# Altium project Main_Board.PrjPcb (part 23 of 44)

## Sheet ADP1741_3.6V_3.3V@2A.SchDoc
size A4
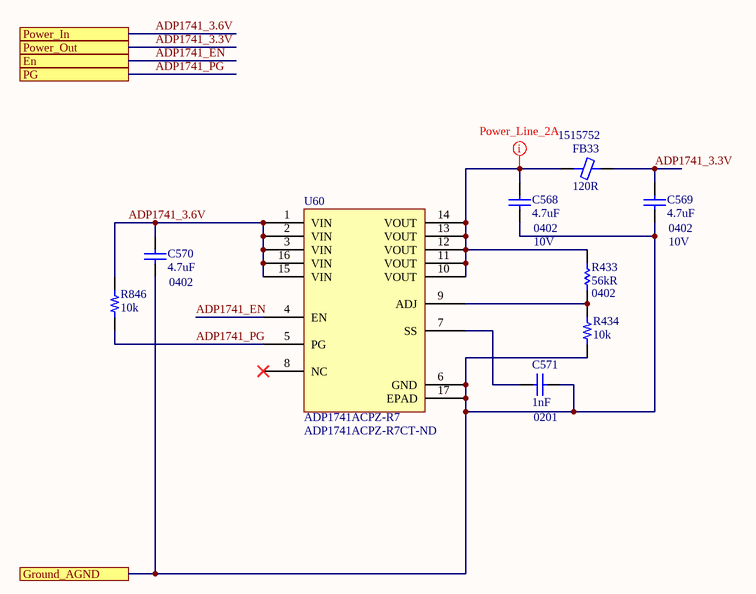
[diagram p29: ADP1741_3.6V_3.3V@2A.SchDoc]

### Parts
(Parts that share a designator on the sheet are numbered #1, #2 ... from top to bottom, then left to right.)
C568  4.7uF  Case/Package: 0402  Voltage Rating: 10V  [CAP 0402/1005 KK]
C569  4.7uF  Case/Package: 0402  Voltage Rating: 10V  [CAP 0402/1005 KK]
C570  4.7uF  Case/Package: 0402  [CAP 0402/1005 KK]
C571  1nF  Case/Package: 0201  [CAP 0201/0603 KK]
FB33  120R  Supplier Part Number 1: 1515752  [FER 0603/1608]
R433  56kR  Case/Package: 0402  [RES 0402/1005 RF KK]
R434  10k  [RES 0402/1005 RF KK]
R846#1  10k  [RES 0402/1005 RF KK]
U60  ADP1741ACPZ-R7  Supplier Part Number 1: ADP1741ACPZ-R7CT-ND  [ADP1752_1753/ADP1740_1741]

### Ports
En, Ground_AGND, PG, Power_In, Power_Out

### Nets
ADP1741_3.3V: C569.2 FB33.2 ; port Power_Out  [project net 3.3V_LN_1]
ADP1741_3.6V: C570.2 R846#1.1 U60.1(VIN) U60.2(VIN) U60.3(VIN) U60.15(VIN) U60.16(VIN) ; port Power_In
ADP1741_EN: U60.4(EN) ; port En
ADP1741_PG: R846#1.2 U60.5(PG) ; port PG
AGND: C568.1 C569.1 C570.1 C571.2 R434.2 U60.6(GND) U60.17(EPAD) ; port Ground_AGND
NetC568_2: C568.2 FB33.1 R433.2 U60.10(VOUT) U60.11(VOUT) U60.12(VOUT) U60.13(VOUT) U60.14(VOUT)
NetC571_1: C571.1 U60.7(SS)
NetR433_1: R433.1 R434.1 U60.9(ADJ)

Not connected (* = marked no-connect by the designer): U60 8(NC)*

### Layout directives
net class Power_Line_2A: NetC568_2

### Notes on the sheet
- Title
- Size:
- Date:
- A3
- Number:
- Time:
- Revision:
- Sheet
- of
- File:

### Library data of the parts
C568 C569 = Capacitor: 0402 10 V 4.7 uF ±20% Tolerance X5R Multilayer Ceramic Chip Capacitor; Manufacturer: Murata; Manufacturer Part Number: GRM155R61A475MEAAD; Supplier 1: Digi-Key; Supplier Part Number 1: 490-14306-1-ND; Category: Ceramic Capacitors; Stock 1: 980102; Pricing 1: 1=0,23000, 10=0,15400, 100=0,07780, 500=0,05322, 1000=0,04708, 2500=0,04504, 5000=0,04094 (USD); Mount: Surface Mount; Case Code (Imperial): 0402; Case Code (Metric): 1005; Min Operating Temperature: -55°C; Max Operating Temperature: 85°C; Packaging: Tape and Reel; Capacitance: 4.7uF; Tolerance: 20%; ComponentLink1URL: http://www.farnell.com/datasheets/2189109.pdf?src-supplier=Farnell; ComponentLink1Description: http://www.farnell.com/datasheets/2189109.pdf?src-supplier=Farnell; ComponentLink2URL: https://search.murata.co.jp/Ceramy/image/img/A01X/G101/ENG/GRM155R61A475MEAA-01.pdf?src-supplier=Digi-Key; ComponentLink2Description: https://search.murata.co.jp/Ceramy/image/img/A01X/G101/ENG/GRM155R61A475MEAA-01.pdf?src-supplier=Digi-Key; ComponentLink3URL: http://datasheet.octopart.com/GRM155R61A475MEAAD-Murata-datasheet-68589269.pdf?src-supplier=Newark; ComponentLink3Description: http://datasheet.octopart.com/GRM155R61A475MEAAD-Murata-datasheet-68589269.pdf?src-supplier=Newark; ComponentLink4URL: http://datasheet.octopart.com/GRM155R61A475MEAAD-Murata-datasheet-8819587.pdf; ComponentLink4Description: http://datasheet.octopart.com/GRM155R61A475MEAAD-Murata-datasheet-8819587.pdf; ComponentLink5URL: http://datasheet.octopart.com/GRM155R61A475MEAAD-Murata-datasheet-10025737.pdf; ComponentLink5Description: http://datasheet.octopart.com/GRM155R61A475MEAAD-Murata-datasheet-10025737.pdf; ComponentLink6URL: http://datasheet.octopart.com/GRM155R61A475MEAAD-Murata-datasheet-11978611.pdf; ComponentLink6Description: http://datasheet.octopart.com/GRM155R61A475MEAAD-Murata-datasheet-11978611.pdf; ComponentLink7URL: http://datasheet.octopart.com/GRM155R61A475MEAAD-Murata-datasheet-12510076.pdf; ComponentLink7Description: http://datasheet.octopart.com/GRM155R61A475MEAAD-Murata-datasheet-12510076.pdf; ComponentLink8URL: http://datasheet.octopart.com/GRM155R61A475MEAAD-Murata-datasheet-12515295.pdf; ComponentLink8Description: http://datasheet.octopart.com/GRM155R61A475MEAAD-Murata-datasheet-12515295.pdf
C570 = Capacitor: 0402 10 V 4.7 uF ±20% Tolerance X5R Multilayer Ceramic Chip Capacitor; Manufacturer: Murata; Manufacturer Part Number: GRM155R61A475MEAAD; Voltage Rating: 10V; Supplier 1: Digi-Key; Supplier Part Number 1: 490-14306-1-ND; Category: Ceramic Capacitors; Stock 1: 980102; Pricing 1: 1=0,23000, 10=0,15400, 100=0,07780, 500=0,05322, 1000=0,04708, 2500=0,04504, 5000=0,04094 (USD); Mount: Surface Mount; Case Code (Imperial): 0402; Case Code (Metric): 1005; Min Operating Temperature: -55°C; Max Operating Temperature: 85°C; Packaging: Tape and Reel; Capacitance: 4.7uF; Tolerance: 20%; ComponentLink1URL: http://www.farnell.com/datasheets/2189109.pdf?src-supplier=Farnell; ComponentLink1Description: http://www.farnell.com/datasheets/2189109.pdf?src-supplier=Farnell; ComponentLink2URL: https://search.murata.co.jp/Ceramy/image/img/A01X/G101/ENG/GRM155R61A475MEAA-01.pdf?src-supplier=Digi-Key; ComponentLink2Description: https://search.murata.co.jp/Ceramy/image/img/A01X/G101/ENG/GRM155R61A475MEAA-01.pdf?src-supplier=Digi-Key; ComponentLink3URL: http://datasheet.octopart.com/GRM155R61A475MEAAD-Murata-datasheet-68589269.pdf?src-supplier=Newark; ComponentLink3Description: http://datasheet.octopart.com/GRM155R61A475MEAAD-Murata-datasheet-68589269.pdf?src-supplier=Newark; ComponentLink4URL: http://datasheet.octopart.com/GRM155R61A475MEAAD-Murata-datasheet-8819587.pdf; ComponentLink4Description: http://datasheet.octopart.com/GRM155R61A475MEAAD-Murata-datasheet-8819587.pdf; ComponentLink5URL: http://datasheet.octopart.com/GRM155R61A475MEAAD-Murata-datasheet-10025737.pdf; ComponentLink5Description: http://datasheet.octopart.com/GRM155R61A475MEAAD-Murata-datasheet-10025737.pdf; ComponentLink6URL: http://datasheet.octopart.com/GRM155R61A475MEAAD-Murata-datasheet-11978611.pdf; ComponentLink6Description: http://datasheet.octopart.com/GRM155R61A475MEAAD-Murata-datasheet-11978611.pdf; ComponentLink7URL: http://datasheet.octopart.com/GRM155R61A475MEAAD-Murata-datasheet-12510076.pdf; ComponentLink7Description: http://datasheet.octopart.com/GRM155R61A475MEAAD-Murata-datasheet-12510076.pdf; ComponentLink8URL: http://datasheet.octopart.com/GRM155R61A475MEAAD-Murata-datasheet-12515295.pdf; ComponentLink8Description: http://datasheet.octopart.com/GRM155R61A475MEAAD-Murata-datasheet-12515295.pdf
C571 = Capacitor: CAP CER 1000PF 25V X5R 0201; Manufacturer: Murata; Manufacturer Part Number: GRM033R61E102KA01D; Tolerance: 10%; Supplier 1: Digi-Key; Supplier Part Number 1: 490-14452-1-ND; RoHS: Yes; Category: Ceramic Capacitors; Stock 1: 80983; Pricing 1: 1=0,10000, 10=0,01800, 100=0,00790, 500=0,00564, 1000=0,00443, 2500=0,00402, 5000=0,00370 (USD); Min Operating Temperature: -55°C; Max Operating Temperature: 85°C; Packaging: Tape and Reel; Capacitance: 1nF; Dielectric: X5R; Voltage Rating (DC): 25V; Length: 0.6mm; Depth: 0.3mm; Width: 300um; Thickness: 300um; ComponentLink1URL: http://components.arrow.com/part/dataview/0323_06094941?src-supplier=Arrow+Europe; ComponentLink1Description: http://components.arrow.com/part/dataview/0323_06094941?src-supplier=Arrow+Europe; ComponentLink2URL: https://search.murata.co.jp/Ceramy/image/img/A01X/G101/ENG/GRM033R61E102KA01-01.pdf?src-supplier=Digi-Key; ComponentLink2Description: https://search.murata.co.jp/Ceramy/image/img/A01X/G101/ENG/GRM033R61E102KA01-01.pdf?src-supplier=Digi-Key; ComponentLink3URL: http://search.murata.co.jp/Ceramy/image/img/A01X/G101/ENG/GRM033R61E102KA01-01.pdf?src-supplier=Digi-Key; ComponentLink3Description: http://search.murata.co.jp/Ceramy/image/img/A01X/G101/ENG/GRM033R61E102KA01-01.pdf?src-supplier=Digi-Key
FB33 = Ferrite: Ind Chip Bead 120Ohm 25% 100MHz Ferrite 3A 0603 Paper T/R; Manufacturer: Murata; Manufacturer Part Number: BLM18SG121TN1D; Material: Steel,Ferrite; DC Resistance (DCR): 25mR; Number of Circuits: 1; Shielding: Unshielded; Supplier 1: Farnell; RoHS: Yes; Category: Ferrite Beads and Chips; Stock 1: 47191; Case/Package: 0603; Number of Pins: 2; Core Material: Ferrite; Case Code (Metric): 1608; Case Code (Imperial): 0603; Min Operating Temperature: -55°C; Max Operating Temperature: 125°C; Impedance: 120R; Packaging: Tape and Reel; Current Rating: 3A; Tolerance: 25%; Max DC Current: 3A; Package Quantity: 1; Max Current Rating: 3A; Number of Lines: 1; Termination: SMD/SMT; Test Frequency: 100MHz; Frequency: 100MHz; Length: 1.6mm; Height: 0.8mm; Width: 0.8mm; Depth: 0.8mm; REACH SVHC: No SVHC; Lead Free: Lead Free; ComponentLink1URL: https://datasheet.ciiva.com/1012/l0110s0100blm18s-1012624.pdf?src-supplier=Digi-Key; ComponentLink1Description: https://datasheet.ciiva.com/1012/l0110s0100blm18s-1012624.pdf?src-supplier=Digi-Key; ComponentLink2URL: https://datasheet.ciiva.com/18093/getdatasheetpartid-295885-18093249.pdf?src-supplier=Verical; ComponentLink2Description: https://datasheet.ciiva.com/18093/getdatasheetpartid-295885-18093249.pdf?src-supplier=Verical; ComponentLink3URL: https://datasheet.ciiva.com/11799/0900766b811b5866-11799181.pdf?src-supplier=RSComponents; ComponentLink3Description: https://datasheet.ciiva.com/11799/0900766b811b5866-11799181.pdf?src-supplier=RSComponents; ComponentLink4URL: https://datasheet.ciiva.com/41449/001171723-da-01-en-chip-drossel0603-120r-3000ma-1-6x0-8mm-41449353.pdf?src-supplier=Conrad; ComponentLink4Description: https://datasheet.ciiva.com/41449/001171723-da-01-en-chip-drossel0603-120r-3000ma-1-6x0-8mm-41449353.pdf?src-supplier=Conrad; ComponentLink5URL: https://datasheet.ciiva.com/41449/001172312-da-01-en-drossel-0603-120r-1-6x0-8mm-10000st-41449675.pdf?src-supplier=Conrad; ComponentLink5Description: https://datasheet.ciiva.com/41449/001172312-da-01-en-drossel-0603-120r-1-6x0-8mm-10000st-41449675.pdf?src-supplier=Conrad; ComponentLink6URL: https://datasheet.ciiva.com/1012/l0110s0100blm18s-1012625.pdf?src-supplier=Digi-Key; ComponentLink6Description: https://datasheet.ciiva.com/1012/l0110s0100blm18s-1012625.pdf?src-supplier=Digi-Key; ComponentLink7URL: https://datasheet.ciiva.com/8021/5151-8021511.pdf?src-supplier=Element14; ComponentLink7Description: https://datasheet.ciiva.com/8021/5151-8021511.pdf?src-supplier=Element14; ComponentLink8URL: https://datasheet.ciiva.com/8021/5151-8021512.pdf?src-supplier=Element14; ComponentLink8Description: https://datasheet.ciiva.com/8021/5151-8021512.pdf?src-supplier=Element14; ComponentLink9URL: https://datasheet.ciiva.com/14122/blm-series-eng-tds-14122906.pdf?src-supplier=Distrelec; ComponentLink9Description: https://datasheet.ciiva.com/14122/blm-series-eng-tds-14122906.pdf?src-supplier=Distrelec; ComponentLink10URL: https://datasheet.ciiva.com/16395/l0110s0100blm18s-16395498.pdf?src-supplier=Future+Electronics; ComponentLink10Description: https://datasheet.ciiva.com/16395/l0110s0100blm18s-16395498.pdf?src-supplier=Future+Electronics; ComponentLink11URL: https://datasheet.ciiva.com/1012/l0110s0100blm18s-1012623.pdf?src-supplier=Digi-Key; ComponentLink11Description: https://datasheet.ciiva.com/1012/l0110s0100blm18s-1012623.pdf?src-supplier=Digi-Key; ComponentLink12URL: https://datasheet.ciiva.com/17246/l0110s0100blm18s-17246943.pdf?src-supplier=Avnet+Europe; ComponentLink12Description: https://datasheet.ciiva.com/17246/l0110s0100blm18s-17246943.pdf?src-supplier=Avnet+Europe
R433 = Resistor: RES 56K OHM 1% 1/16W 0402; Manufacturer: Stackpole Electronics; Manufacturer Part Number: RMCF0402FT56K0; Max Power Dissipation: 63mW; Temperature Coefficient: 100ppm/°C; Supplier 1: Digi-Key; Supplier Part Number 1: RMCF0402FT56K0CT-ND; RoHS: Yes; Category: Chip SMD Resistors; Stock 1: 59738; Pricing 1: 1=0,10000, 10=0,01400, 100=0,00580, 1000=0,00262, 2500=0,00228, 5000=0,00188 (USD); Mount: Surface Mount; Case Code (Metric): 1005; Case Code (Imperial): 0402; Contact Plating: Tin,Matte; Min Operating Temperature: -55°C; Max Operating Temperature: 155°C; Packaging: Tape and Reel; Resistance: 56kR; Tolerance: 1%; Package Quantity: 10000; Composition: Thick Film; Number of Terminations: 2; Features: Automotive AEC-Q200; Length: 0.039inch; Height: 0.016inch; Width: 0.02inch; Radiation Hardening: No; ComponentLink1URL: https://www.seielect.com/catalog/SEI-RMCF_RMCP.pdf?src-supplier=Avnet; ComponentLink1Description: https://www.seielect.com/catalog/SEI-RMCF_RMCP.pdf?src-supplier=Avnet; ComponentLink2URL: http://www.seielect.com/Catalog/SEI-RMCF_RMCP.pdf?src-supplier=Digi-Key; ComponentLink2Description: http://www.seielect.com/Catalog/SEI-RMCF_RMCP.pdf?src-supplier=Digi-Key; ComponentLink3URL: https://www.seielect.com/catalog/SEI-Packaging.pdf?src-supplier=Digi-Key; ComponentLink3Description: https://www.seielect.com/catalog/SEI-Packaging.pdf?src-supplier=Digi-Key; ComponentLink4URL: https://www.seielect.com/Catalog/SEI-RMCF_RMCP.pdf?src-supplier=Digi-Key; ComponentLink4Description: https://www.seielect.com/Catalog/SEI-RMCF_RMCP.pdf?src-supplier=Digi-Key
R434 R846#1 = Resistor: SMT Resistor; Value: 10k; Part Number: *; Supplier 1: Digi-Key; Supplier Part Number 1: RR05P10.0KDCT-ND
U60 = ADP1741ACPZ-R7: IC REG LIN POS ADJ 2A 16LFCSP; Manufacturer: Analog Devices; Output Voltage: 3V; Max Input Voltage: 3.6V; Min Input Voltage: 1.6V; Min Output Voltage: 750mV; Operating Supply Current: 1.8mA; Power Supply Rejection Ratio (PSRR): 70dB; Dropout Voltage: 160mV; Number of Outputs: 1; Min Current Limit: 2.4A; Polarity: Positive; Accuracy: 1%; Output Type: Adjustable; Supplier 1: Digi-Key; Manufacturer Part Number: ADP1741ACPZ-R7; Stock 1: 7057; Pricing 1: 1 = 3,42000, 10 = 3,07000, 25 = 2,90240, 100 = 2,51540, 250 = 2,38644, 500 = 2,14136 (USD); RoHS: Yes; Case/Package: LFCSP EP; Number of Pins: 16; Min Operating Temperature: -40°C; Max Operating Temperature: 125°C; Output Current: 2A; Max Output Current: 2A; Packaging: Tape and Reel; Max Output Voltage: 3V; Max Supply Current: 1.8mA; Number of Regulators: 1; Output Voltage Accuracy: 1%; Radiation Hardening: No; REACH SVHC: No SVHC; Lead Free: Contains Lead; ComponentLink1URL: https://datasheet.ciiva.com/2041/adp1740-1741-2041344.pdf?src-supplier=Digi-Key; ComponentLink1Description: https://datasheet.ciiva.com/2041/adp1740-1741-2041344.pdf?src-supplier=Digi-Key; ComponentLink2URL: https://datasheet.ciiva.com/15364/adp1740-1741-259394-15364336.pdf?src-supplier=Mouser; ComponentLink2Description: https://datasheet.ciiva.com/15364/adp1740-1741-259394-15364336.pdf?src-supplier=Mouser; ComponentLink3URL: https://datasheet.ciiva.com/23604/697190-23604608.pdf?src-supplier=Newark; ComponentLink3Description: https://datasheet.ciiva.com/23604/697190-23604608.pdf?src-supplier=Newark; ComponentLink4URL: https://datasheet.ciiva.com/2041/adp1740-1741-2041345.pdf?src-supplier=Digi-Key; ComponentLink4Description: https://datasheet.ciiva.com/2041/adp1740-1741-2041345.pdf?src-supplier=Digi-Key; ComponentLink5URL: https://datasheet.ciiva.com/3224/adp1740-1741-3224694.pdf?src-supplier=Avnet; ComponentLink5Description: https://datasheet.ciiva.com/3224/adp1740-1741-3224694.pdf?src-supplier=Avnet; ComponentLink6URL: https://datasheet.ciiva.com/17365/adp1740-1741-17365261.pdf?src-supplier=Avnet+Europe; ComponentLink6Description: https://datasheet.ciiva.com/17365/adp1740-1741-17365261.pdf?src-supplier=Avnet+Europe; ComponentLink7URL: https://datasheet.ciiva.com/2041/adp1740-1741-2041343.pdf?src-supplier=Digi-Key; ComponentLink7Description: https://datasheet.ciiva.com/2041/adp1740-1741-2041343.pdf?src-supplier=Digi-Key

## Sheet 5V_to_3V3.SchDoc: 5V_to_3V3
size A4
Used 3 times, as channels PowerDistribition/Zasilanie CLK/5to3V3_1, PowerDistribition/Zasilanie CLK/5to3V3_2, U_Peripherals/Debug/5V_to_3V3_for_FTDI. Parts and nets are listed once, with the designators drawn on the sheet.
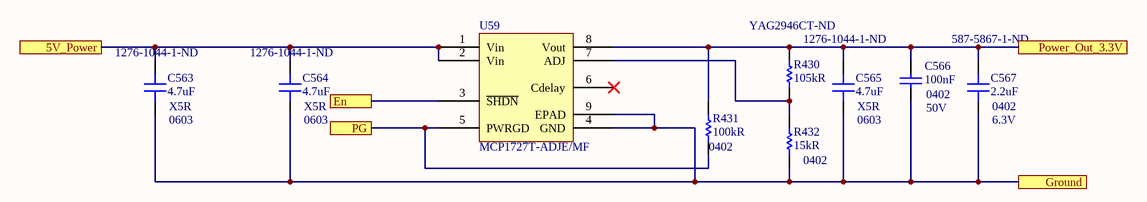
[diagram p30: 5V_to_3V3.SchDoc]

### Parts
C563  4.7uF  Supplier Part Number 1: 1276-1044-1-ND  Case/Package: 0603  Dielectric: X5R  [CAP 0603/1608 RF]
C564  4.7uF  Supplier Part Number 1: 1276-1044-1-ND  Case/Package: 0603  Dielectric: X5R  [CAP 0603/1608 RF]
C565  4.7uF  Supplier Part Number 1: 1276-1044-1-ND  Case/Package: 0603  Dielectric: X5R  [CAP 0603/1608 RF]
C566  100nF  Case Code (Imperial): 0402  Voltage: 50V  [CAP 0402/1005 KK]
C567  2.2uF  Supplier Part Number 1: 587-5867-1-ND  Case Code (Imperial): 0402  Voltage Rating: 6.3V  [CAP 0402/1005 KK]
R430  105kR  Supplier Part Number 1: YAG2946CT-ND  [RES 0402/1005 RF KK]
R431  100kR  Case/Package: 0402  [RES 0402/1005 RF KK]
R432  15kR  Case Code (Imperial): 0402  [RES 0402/1005 RF KK]
U59  MCP1727T-ADJE/MF  [MCP1727T-ADJE/MF]

### Ports
5V_Power, En, Ground, PG, Power_Out_3.3V

### Nets
5V_Power: C563.2 C564.2 U59.1(Vin) U59.2(Vin) ; port 5V_Power
En: U59.3(~{SHDN}) ; port En
Ground: C563.1 C564.1 C565.1 C566.1 C567.1 R432.1 U59.4(GND) U59.9(EPAD) ; port Ground
PG: R431.1 U59.5(PWRGD) ; port PG
Power_Out_3.3V: C565.2 C566.2 C567.2 R430.2 R431.2 U59.8(Vout) ; port Power_Out_3.3V
NetR430_1: R430.1 R432.2 U59.7(ADJ)

Not connected (* = marked no-connect by the designer): U59 6(Cdelay)*

### Channels
PowerDistribition/Zasilanie CLK/5to3V3_1: designators end in _5to3V3_1; ports 5V_Power=5V_RAIL En=EN_PS_LTC6952_1 Ground=AGND PG=PG_PS_LTC6952_1 Power_Out_3.3V=3.3V_Stable_1
PowerDistribition/Zasilanie CLK/5to3V3_2: designators end in _5to3V3_2; ports 5V_Power=5V_RAIL En=EN_PS_LTC6952_2 Ground=AGND PG=PG_PS_LTC6952_2 Power_Out_3.3V=3.3V_Stable_2
U_Peripherals/Debug/5V_to_3V3_for_FTDI: designators end in _5V_to_3V3_for_FTDI; ports 5V_Power=FTDI_5V En=FTDI_5V Ground=FTDI_GND PG=NetR431_5V_to_3V3_for_FTDI_1 Power_Out_3.3V=FTDI_VccIO

### Notes on the sheet
- Title
- Size:
- Date:
- A3
- Number:
- Time:
- Revision:
- Sheet
- of
- File:

### Library data of the parts
C563-C565 = Capacitor: as C308 on sheet Power_Low_Curr; Supplier 1: Digi-Key; Stock 1: 2124648; Pricing 1: 1 = 0,13000, 10 = 0,09600, 100 = 0,04520, 500 = 0,03168, 1000 = 0,02622 (USD); RoHS: Yes; Mount: Surface Mount; Case Code (Metric): 1608; Case Code (Imperial): 0603; Contact Plating: Tin; Min Operating Temperature: -55°C; Max Operating Temperature: 85°C; Capacitance: 4.7uF; Package Quantity: 1; Packaging: Tape and Reel; Length: 1.6mm; Height: 0.8mm; Width: 0.031inch; Thickness: 0.035inch; Depth: 0.8mm; Radiation Hardening: No; ComponentLink1URL: https://datasheet.ciiva.com/25797/cl10a475kp8nnnc-25797520.pdf?src-supplier=Digi-Key; ComponentLink1Description: https://datasheet.ciiva.com/25797/cl10a475kp8nnnc-25797520.pdf?src-supplier=Digi-Key; ComponentLink2URL: https://datasheet.ciiva.com/26838/getdatasheetpartid-358676-26838384.pdf?src-supplier=Verical; ComponentLink2Description: https://datasheet.ciiva.com/26838/getdatasheetpartid-358676-26838384.pdf?src-supplier=Verical; ComponentLink3URL: https://datasheet.ciiva.com/16318/cl05b104kq5nnnc-16318245.pdf?src-supplier=Future+Electronics; ComponentLink3Description: https://datasheet.ciiva.com/16318/cl05b104kq5nnnc-16318245.pdf?src-supplier=Future+Electronics
C566 = Capacitor: as C623 on sheet Power_Low_Curr; Supplier 1: Digi-Key; Supplier Part Number 1: 490-10697-1-ND; RoHS: Yes; Category: Ceramic Capacitors; Stock 1: 435607; Pricing 1: 1=0,10000, 10=0,04600, 100=0,02050, 500=0,01464, 1000=0,01150, 2500=0,01045, 5000=0,00961 (USD); Mount: Surface Mount; Case/Package: 0402; Weight: 0.000212oz; Case Code (Metric): 1005; Min Operating Temperature: -55°C; Max Operating Temperature: 85°C; Capacitance: 100nF; Packaging: Tape and Reel; Voltage Rating: 50V; Dielectric: X5R; Termination: SMD/SMT; Composition: Ceramic; Voltage Rating (DC): 50V; Package Quantity: 10000; Length: 1mm; Height: 0.5mm; Width: 0.02inch; Thickness: 0.022inch; Depth: 0.5mm; REACH SVHC: No SVHC; Lead Free: Lead Free; ComponentLink1URL: http://www.farnell.com/datasheets/2079150.pdf?src-supplier=Farnell; ComponentLink1Description: http://www.farnell.com/datasheets/2079150.pdf?src-supplier=Farnell; ComponentLink2URL: http://www.mouser.com/ds/2/281/c02e-2905.pdf?src-supplier=Mouser; ComponentLink2Description: http://www.mouser.com/ds/2/281/c02e-2905.pdf?src-supplier=Mouser; ComponentLink3URL: http://www.farnell.com/datasheets/2079150.pdf?src-supplier=Element14; ComponentLink3Description: http://www.farnell.com/datasheets/2079150.pdf?src-supplier=Element14; ComponentLink4URL: http://search.murata.co.jp/Ceramy/image/img/A01X/G101/ENG/GRM155R61H104KE14-01.pdf?src-supplier=Digi-Key; ComponentLink4Description: http://search.murata.co.jp/Ceramy/image/img/A01X/G101/ENG/GRM155R61H104KE14-01.pdf?src-supplier=Digi-Key
C567 = Capacitor: CAP CER 2.2UF 6.3V X5R 0402; Manufacturer: Taiyo Yuden; Manufacturer Part Number: JMK105BJ225KV-F; Tolerance: 10%; Supplier 1: Digi-Key; RoHS: Yes; Category: Ceramic Capacitors; Stock 1: 4812; Pricing 1: 1=0,10000, 10=0,06000, 100=0,02650, 500=0,01894, 1000=0,01488, 2500=0,01352, 5000=0,01244 (USD); Mount: Surface Mount; Case/Package: 0402; Case Code (Metric): 1005; Min Operating Temperature: -55°C; Max Operating Temperature: 85°C; Packaging: Tape and Reel; Capacitance: 2.2uF; Package Quantity: 10000; Voltage Rating (DC): 6.3V; Dielectric: X5R; Termination: SMD/SMT; Composition: Ceramic; Length: 1mm; Height: 0.5mm; Width: 0.5mm; Thickness: 0.022inch; Depth: 0.5mm; Radiation Hardening: No; ComponentLink1URL: https://datasheet.ciiva.com/15921/tmk105b7103kv-15921011.pdf?src-supplier=Onlinecomponents.com; ComponentLink1Description: https://datasheet.ciiva.com/15921/tmk105b7103kv-15921011.pdf?src-supplier=Onlinecomponents.com; ComponentLink2URL: https://datasheet.ciiva.com/30178/cmultilayerceramiccapacitor-30178599.pdf?src-supplier=Onlinecomponents.com; ComponentLink2Description: https://datasheet.ciiva.com/30178/cmultilayerceramiccapacitor-30178599.pdf?src-supplier=Onlinecomponents.com
R430 = Resistor: Thick Film Resistors - SMD 105K OHM 1%; Manufacturer: Yageo; Manufacturer Part Number: RC0402FR-07105KL; Power Rating: 62.5mW; Voltage Rating: 50V; Max Power Dissipation: 63mW; Temperature Coefficient: 100ppm/°C; Supplier 1: Digi-Key; RoHS: Yes; Category: Chip SMD Resistors; Stock 1: 641531; Pricing 1: 1=0,10000, 10=0,01600, 100=0,00640, 1000=0,00289, 2500=0,00251, 5000=0,00207 (USD); Case/Package: 0402; Case Code (Imperial): 0402; Case Code (Metric): 1005; Contact Plating: Tin,Lead,Matte; Min Operating Temperature: -55°C; Max Operating Temperature: 155°C; Tolerance: 1%; Resistance: 105kR; Packaging: Tape and Reel; Composition: Thick Film; Number of Terminations: 2; Termination: SMD/SMT; Military Standard: Not; Features: Moisture Resistant; Length: 1mm; Height: 0.016inch; Width: 0.02inch; Depth: 0.5mm; Radiation Hardening: No; Lead Free: Lead Free; ComponentLink1URL: https://datasheet.ciiva.com/16869/pyu-rc0402-51-rohs-l-6-16869544.pdf?src-supplier=Avnet+Europe; ComponentLink1Description: https://datasheet.ciiva.com/16869/pyu-rc0402-51-rohs-l-6-16869544.pdf?src-supplier=Avnet+Europe; ComponentLink2URL: https://datasheet.ciiva.com/12575/pyu-rc0402-51-rohs-l-6-r-8721-12575887.pdf?src-supplier=Mouser; ComponentLink2Description: https://datasheet.ciiva.com/12575/pyu-rc0402-51-rohs-l-6-r-8721-12575887.pdf?src-supplier=Mouser; ComponentLink3URL: https://datasheet.ciiva.com/8887/pyu-rc0402-51-rohs-l-6-8887815.pdf?src-supplier=Avnet; ComponentLink3Description: https://datasheet.ciiva.com/8887/pyu-rc0402-51-rohs-l-6-8887815.pdf?src-supplier=Avnet; ComponentLink4URL: https://datasheet.ciiva.com/28395/pyu-rc0402-51-rohs-l-6-28395228.pdf?src-supplier=Avnet+Europe; ComponentLink4Description: https://datasheet.ciiva.com/28395/pyu-rc0402-51-rohs-l-6-28395228.pdf?src-supplier=Avnet+Europe
R431 = Resistor: Manufacturer 1: Panasonic; Manufacturer Part Number 1: ERA-2AED104X; Tolerance: 0.5%; Power Rating: 63mW; Voltage Rating: 25V; Temperature Coefficient: 25ppm/°C; Supplier 1: Digi-Key; Supplier Part Number 1: P100KDECT-ND; Stock 1: 54338; Pricing 1: 1=0.22000, 10=0.18800, 100=0.07350, 1000=0.03077, 2500=0.02820, 5000=0.02564 (USD); RoHS: Yes; Mount: Surface Mount; Case Code (Imperial): 0402; Case Code (Metric): 1005; Contact Plating: Tin; Min Operating Temperature: -55°C; Max Operating Temperature: 155°C; Resistance: 100kR; Packaging: Tape and Reel; Package Quantity: 10000; Composition: Metal Film,Thin Film; Number of Terminations: 2; Military Standard: Not; Termination: SMD/SMT; Max Power Dissipation: 63mW; Voltage Rating (DC): 25V; Length: 1mm; Height: 0.016inch; Width: 0.5mm; Depth: 0.5mm; Radiation Hardening: No; REACH SVHC: No SVHC; Lead Free: Lead Free; ComponentLink1URL: https://datasheet.ciiva.com/24028/aoa0000ce26-197354-24028150.pdf?src-supplier=Mouser; ComponentLink1Description: https://datasheet.ciiva.com/24028/aoa0000ce26-197354-24028150.pdf?src-supplier=Mouser; ComponentLink2URL: https://datasheet.ciiva.com/43470/1776116-43470438.pdf?src-supplier=Farnell; ComponentLink2Description: https://datasheet.ciiva.com/43470/1776116-43470438.pdf?src-supplier=Farnell; ComponentLink3URL: https://datasheet.ciiva.com/7830/1776116-7830920.pdf?src-supplier=Element14; ComponentLink3Description: https://datasheet.ciiva.com/7830/1776116-7830920.pdf?src-supplier=Element14; ComponentLink4URL: https://datasheet.ciiva.com/46378/1776116-46378234.pdf?src-supplier=Element14; ComponentLink4Description: https://datasheet.ciiva.com/46378/1776116-46378234.pdf?src-supplier=Element14; ComponentLink5URL: https://datasheet.ciiva.com/16780/70068849-16780139.pdf?src-supplier=Allied+Electronics; ComponentLink5Description: https://datasheet.ciiva.com/16780/70068849-16780139.pdf?src-supplier=Allied+Electronics; ComponentLink6URL: https://datasheet.ciiva.com/9117/aoa0000ce26-9117229.pdf?src-supplier=Avnet; ComponentLink6Description: https://datasheet.ciiva.com/9117/aoa0000ce26-9117229.pdf?src-supplier=Avnet; ComponentLink7URL: https://datasheet.ciiva.com/16511/aoa0000ce26-16511566.pdf?src-supplier=Avnet+Asia; ComponentLink7Description: https://datasheet.ciiva.com/16511/aoa0000ce26-16511566.pdf?src-supplier=Avnet+Asia; ComponentLink8URL: https://datasheet.ciiva.com/30225/54aoa0000ce26-30225311.pdf?src-supplier=Onlinecomponents.com; ComponentLink8Description: https://datasheet.ciiva.com/30225/54aoa0000ce26-30225311.pdf?src-supplier=Onlinecomponents.com
R432 = Resistor: Manufacturer: Panasonic; Manufacturer Part Number: ERJ-2RKF1502X; Tolerance: 1%; Voltage Rating: 50V; Power Rating: 100mW; Temperature Coefficient: 100ppm/°C; Supplier 1: Digi-Key; Supplier Part Number 1: P15.0KLDKR-ND; Stock 1: 3339464; Pricing 1: 1 = 0,10000, 10 = 0,04100, 100 = 0,01670, 1000 = 0,00751, 2500 = 0,00652, 5000 = 0,00538 (USD); RoHS: Yes; Mount: Surface Mount; Case/Package: 0402; Number of Pins: 2; Weight: 2.8E-05oz; Case Code (Metric): 1005; Contact Plating: Tin; Min Operating Temperature: -55°C; Max Operating Temperature: 155°C; Resistance: 15kR; Packaging: Tape and Reel; Package Quantity: 1; Composition: Thick Film; Termination: SMD/SMT; Number of Terminations: 2; Military Standard: Not; Max Power Dissipation: 100mW; Voltage Rating (DC): 50V; Features: Automotive AEC-Q200; Length: 1mm; Height: 0.35mm; Width: 0.5mm; Depth: 0.5mm; Radiation Hardening: No; REACH SVHC: No SVHC; Lead Free: Lead Free; ComponentLink1URL: https://datasheet.ciiva.com/11821/0900766b80f80784-11821181.pdf?src-supplier=RSComponents; ComponentLink1Description: https://datasheet.ciiva.com/11821/0900766b80f80784-11821181.pdf?src-supplier=RSComponents; ComponentLink2URL: https://datasheet.ciiva.com/16778/70260748-16778682.pdf?src-supplier=Allied+Electronics; ComponentLink2Description: https://datasheet.ciiva.com/16778/70260748-16778682.pdf?src-supplier=Allied+Electronics; ComponentLink3URL: https://datasheet.ciiva.com/46372/1678782-46372862.pdf?src-supplier=Element14; ComponentLink3Description: https://datasheet.ciiva.com/46372/1678782-46372862.pdf?src-supplier=Element14; ComponentLink4URL: https://datasheet.ciiva.com/17211/aoa0000ce2-17211535.pdf?src-supplier=Avnet+Europe; ComponentLink4Description: https://datasheet.ciiva.com/17211/aoa0000ce2-17211535.pdf?src-supplier=Avnet+Europe; ComponentLink5URL: https://datasheet.ciiva.com/46372/1678782-46372863.pdf?src-supplier=Element14; ComponentLink5Description: https://datasheet.ciiva.com/46372/1678782-46372863.pdf?src-supplier=Element14; ComponentLink6URL: https://datasheet.ciiva.com/6138/aoa0000ce2-6138166.pdf?src-supplier=Farnell; ComponentLink6Description: https://datasheet.ciiva.com/6138/aoa0000ce2-6138166.pdf?src-supplier=Farnell; ComponentLink7URL: https://datasheet.ciiva.com/16765/70260748-16765542.pdf?src-supplier=Allied+Electronics; ComponentLink7Description: https://datasheet.ciiva.com/16765/70260748-16765542.pdf?src-supplier=Allied+Electronics; ComponentLink8URL: https://datasheet.ciiva.com/43467/1678782-43467414.pdf?src-supplier=Farnell; ComponentLink8Description: https://datasheet.ciiva.com/43467/1678782-43467414.pdf?src-supplier=Farnell; ComponentLink9URL: https://datasheet.ciiva.com/9193/aoa0000ce2-9193047.pdf?src-supplier=Avnet; ComponentLink9Description: https://datasheet.ciiva.com/9193/aoa0000ce2-9193047.pdf?src-supplier=Avnet; ComponentLink10URL: https://datasheet.ciiva.com/8079/426256-8079609.pdf?src-supplier=Element14; ComponentLink10Description: https://datasheet.ciiva.com/8079/426256-8079609.pdf?src-supplier=Element14; ComponentLink11URL: https://datasheet.ciiva.com/16371/aoa0000ce2-16371499.pdf?src-supplier=Future+Electronics; ComponentLink11Description: https://datasheet.ciiva.com/16371/aoa0000ce2-16371499.pdf?src-supplier=Future+Electronics; ComponentLink12URL: https://datasheet.ciiva.com/22687/1678782-22687068.pdf?src-supplier=Element14; ComponentLink12Description: https://datasheet.ciiva.com/22687/1678782-22687068.pdf?src-supplier=Element14
U59 = MCP1727T-ADJE/MF: IC REG LDO ADJ 1.5A 8DFN; Manufacturer 1: Microchip; Number of Outputs: 1; Min Input Voltage: 2.3V; Max Input Voltage: 6V; Output Voltage: 5V; Dropout Voltage: 330mV; Input Bias Current: 120uA; Reference Voltage: 410mV; Polarity: Positive; Accuracy: 0.5%; Output Type: Adjustable; Supplier 1: Digi-Key; Manufacturer Part Number 1: MCP1727T-ADJE/MF; Stock 1: 9419; Pricing 1: 1=0.84000, 25=0.71080, 100=0.63860 (USD); RoHS: Yes; Mount: Surface Mount; Case/Package: DFN; Contact Plating: Tin,Matte; Min Operating Temperature: -40°C; Max Operating Temperature: 125°C; Package Quantity: 3300; Output Current: 1.5A; Packaging: Tape and Reel; Max Output Current: 1.5A; Quiescent Current: 120uA; Radiation Hardening: No; Lead Free: Lead Free; ComponentLink1URL: https://datasheet.ciiva.com/2057/21999b-2057048.pdf?src-supplier=Digi-Key; ComponentLink1Description: https://datasheet.ciiva.com/2057/21999b-2057048.pdf?src-supplier=Digi-Key; ComponentLink2URL: https://datasheet.ciiva.com/8237/jp027822-8237704.pdf?src-supplier=Avnet; ComponentLink2Description: https://datasheet.ciiva.com/8237/jp027822-8237704.pdf?src-supplier=Avnet; ComponentLink3URL: https://datasheet.ciiva.com/17364/jp027822-17364137.pdf?src-supplier=Avnet+Europe; ComponentLink3Description: https://datasheet.ciiva.com/17364/jp027822-17364137.pdf?src-supplier=Avnet+Europe; Supplier Part Number 1: MCP1727T-ADJE/MFCT-ND

## Sheet LT3042_12V_5V_LNLDO.SchDoc
size A4
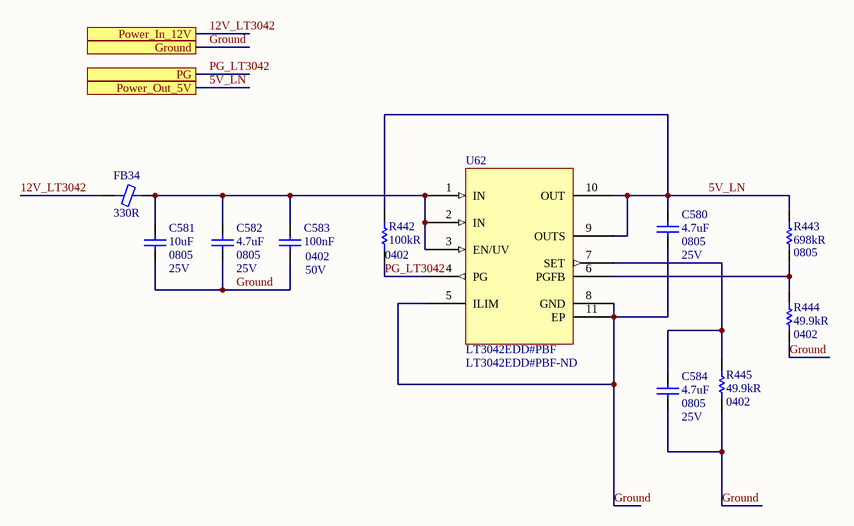
[diagram p31: LT3042_12V_5V_LNLDO.SchDoc]

### Parts
C580  4.7uF  Case/Package: 0805  Voltage Rating: 25V  [CAP 0805/2012 RF]
C581  10uF  Case/Package: 0805  Voltage Rating: 25V  [CAP 0805/2012 RF]
C582  4.7uF  Case/Package: 0805  Voltage Rating: 25V  [CAP 0805/2012 RF]
C583  100nF  Case Code (Imperial): 0402  Voltage: 50V  [CAP 0402/1005 KK]
C584  4.7uF  Case/Package: 0805  Voltage Rating: 25V  [CAP 0805/2012 RF]
FB34  330R  [FER 0603/1608]
R442  100kR  Case/Package: 0402  [RES 0402/1005 RF KK]
R443  698kR  Case/Package: 0805  [RES 0805/2012 RF]
R444  49.9kR  Case/Package: 0402  [RES 0402/1005 RF KK]
R445  49.9kR  Case/Package: 0402  [RES 0402/1005 RF KK]
U62  LT3042EDD#PBF  Supplier Part Number 1: LT3042EDD#PBF-ND  [LT3042]

### Ports
Ground, PG, Power_In_12V, Power_Out_5V

### Nets
5V_LN: C580.2 R442.2 R443.2 U62.9(OUTS) U62.10(OUT) ; port Power_Out_5V
12V_LT3042: FB34.1 ; port Power_In_12V
Ground: C580.1 C581.1 C582.1 C583.1 C584.1 R444.1 R445.1 U62.5(ILIM) U62.8(GND) U62.11(EP) ; port Ground  [project net AGND]
PG_LT3042: R442.1 U62.4(PG) ; port PG
NetC581_2: C581.2 C582.2 C583.2 FB34.2 U62.1(IN) U62.2(IN) U62.3(EN/UV)
NetC584_2: C584.2 R445.2 U62.7(SET)
NetR443_1: R443.1 R444.2 U62.6(PGFB)

### Notes on the sheet
- Title
- Size:
- Date:
- A3
- Number:
- Time:
- Revision:
- Sheet
- of
- File:

### Library data of the parts
C580 C582 C584 = Capacitor: CAP CER 4.7UF 25V X5R 0805; Manufacturer: Murata; Manufacturer Part Number: GRM219R61E475KA73D; Material: Ceramic; Tolerance: 10%; Supplier 1: Digi-Key; Supplier Part Number 1: 490-12753-1-ND; RoHS: Yes; Category: Ceramic Capacitors; Stock 1: 21355; Pricing 1: 1=0,30000, 10=0,20500, 100=0,11610, 500=0,08198, 1000=0,07173 (USD); Mount: Surface Mount; Weight: 0.000335oz; Case Code (Metric): 2012; Case Code (Imperial): 0805; Min Operating Temperature: -55°C; Max Operating Temperature: 85°C; Dielectric: X5R; Capacitance: 4.7uF; Packaging: Tape and Reel; Termination: SMD/SMT; Composition: Ceramic; Voltage Rating (DC): 25V; Package Quantity: 4000; Length: 2mm; Height: 0.85mm; Width: 1.25mm; Thickness: 0.037inch; ComponentLink1URL: http://www.mouser.com/ds/2/281/c02e-2905.pdf?src-supplier=Mouser; ComponentLink1Description: http://www.mouser.com/ds/2/281/c02e-2905.pdf?src-supplier=Mouser; ComponentLink2URL: http://search.murata.co.jp/Ceramy/image/img/A01X/partnumbering_e_01.pdf?src-supplier=Digi-Key; ComponentLink2Description: http://search.murata.co.jp/Ceramy/image/img/A01X/partnumbering_e_01.pdf?src-supplier=Digi-Key; ComponentLink3URL: http://search.murata.co.jp/Ceramy/image/img/A01X/G101/ENG/GRM219R61E475KA73-01.pdf?src-supplier=Digi-Key; ComponentLink3Description: http://search.murata.co.jp/Ceramy/image/img/A01X/G101/ENG/GRM219R61E475KA73-01.pdf?src-supplier=Digi-Key
C581 = Capacitor: CAP CER 10UF 25V X5R 0805; Manufacturer: KEMET; Manufacturer Part Number: C0805C106K3PACTU; Dielectric Material: Ceramic; Dissipation Factor: 10%; Supplier 1: Digi-Key; Supplier Part Number 1: 399-11939-6-ND; RoHS: Yes; Category: Ceramic Capacitors; Stock 1: 4800; Pricing 1: 1=0,24000, 10=0,16800, 100=0,09510, 500=0,06710, 1000=0,05872 (USD); Mount: Surface Mount; Case Code (Metric): 2012; Case Code (Imperial): 0805; Min Operating Temperature: -55°C; Max Operating Temperature: 85°C; Dielectric: X5R; Packaging: Cut Tape; Voltage: 25V; Termination: Solder; Tolerance: 10%; Voltage Rating (DC): 25V; Capacitance: 10uF; Length: 0.079inch; Height: 1.25mm; Depth: 1.25mm; Width: 0.049inch; Thickness: 0.057inch; REACH SVHC: No SVHC; Lead Free: Lead Free; ComponentLink1URL: http://www.farnell.com/datasheets/2741185.pdf?src-supplier=Farnell; ComponentLink1Description: http://www.farnell.com/datasheets/2741185.pdf?src-supplier=Farnell; ComponentLink2URL: http://www.farnell.com/datasheets/2112054.pdf?src-supplier=Farnell; ComponentLink2Description: http://www.farnell.com/datasheets/2112054.pdf?src-supplier=Farnell; ComponentLink3URL: http://www.alliedelec.com/m/d/f3c02ddb98afa3dd1adcb801109671e9.pdf?src-supplier=Allied+Electronics; ComponentLink3Description: http://www.alliedelec.com/m/d/f3c02ddb98afa3dd1adcb801109671e9.pdf?src-supplier=Allied+Electronics; ComponentLink4URL: http://www.farnell.com/datasheets/2112054.pdf?src-supplier=Element14; ComponentLink4Description: http://www.farnell.com/datasheets/2112054.pdf?src-supplier=Element14; ComponentLink5URL: https://api.kemet.com/component-edge/download/datasheet/C0805C106K3PAC7800.pdf?src-supplier=Digi-Key; ComponentLink5Description: https://api.kemet.com/component-edge/download/datasheet/C0805C106K3PAC7800.pdf?src-supplier=Digi-Key; ComponentLink6URL: http://www.kemet.com/docfinder?Partnumber=C0805C106K3PAC7800&src-supplier=Digi-Key; ComponentLink6Description: http://www.kemet.com/docfinder?Partnumber=C0805C106K3PAC7800&src-supplier=Digi-Key; ComponentLink7URL: http://www.kemet.com/Lists/ProductCatalog/Attachments/19/KEM_C1006_X5R_SMD.pdf?src-supplier=Avnet; ComponentLink7Description: http://www.kemet.com/Lists/ProductCatalog/Attachments/19/KEM_C1006_X5R_SMD.pdf?src-supplier=Avnet
C583 = Capacitor: as C623 on sheet Power_Low_Curr; Supplier 1: Digi-Key; Supplier Part Number 1: 490-10697-1-ND; RoHS: Yes; Category: Ceramic Capacitors; Stock 1: 435607; Pricing 1: 1=0,10000, 10=0,04600, 100=0,02050, 500=0,01464, 1000=0,01150, 2500=0,01045, 5000=0,00961 (USD); Mount: Surface Mount; Case/Package: 0402; Weight: 0.000212oz; Case Code (Metric): 1005; Min Operating Temperature: -55°C; Max Operating Temperature: 85°C; Capacitance: 100nF; Packaging: Tape and Reel; Voltage Rating: 50V; Dielectric: X5R; Termination: SMD/SMT; Composition: Ceramic; Voltage Rating (DC): 50V; Package Quantity: 10000; Length: 1mm; Height: 0.5mm; Width: 0.02inch; Thickness: 0.022inch; Depth: 0.5mm; REACH SVHC: No SVHC; Lead Free: Lead Free; ComponentLink1URL: http://www.farnell.com/datasheets/2079150.pdf?src-supplier=Farnell; ComponentLink1Description: http://www.farnell.com/datasheets/2079150.pdf?src-supplier=Farnell; ComponentLink2URL: http://www.mouser.com/ds/2/281/c02e-2905.pdf?src-supplier=Mouser; ComponentLink2Description: http://www.mouser.com/ds/2/281/c02e-2905.pdf?src-supplier=Mouser; ComponentLink3URL: http://www.farnell.com/datasheets/2079150.pdf?src-supplier=Element14; ComponentLink3Description: http://www.farnell.com/datasheets/2079150.pdf?src-supplier=Element14; ComponentLink4URL: http://search.murata.co.jp/Ceramy/image/img/A01X/G101/ENG/GRM155R61H104KE14-01.pdf?src-supplier=Digi-Key; ComponentLink4Description: http://search.murata.co.jp/Ceramy/image/img/A01X/G101/ENG/GRM155R61H104KE14-01.pdf?src-supplier=Digi-Key
FB34 = Ferrite: Ferrite Beads Power Chip 330Ohm 25% 100MHz 800mA 210mOhm DCR 0603 Automotive T/R; Manufacturer: Taiyo Yuden; Manufacturer Part Number: FBMH1608HL331-T; Shielding: Unshielded; Number of Lines: 1; DC Resistance (DCR): 210mR; Max DC Current: 600mA; Supplier 1: Digi-Key; Supplier Part Number 1: 587-1734-1-ND; RoHS: Yes; Category: Ferrite Beads and Chips; Stock 1: 4788; Pricing 1: 1=0,11000, 10=0,09400, 25=0,07320, 50=0,06060, 100=0,05230, 250=0,04180, 500=0,03762, 1000=0,03135 (USD); Mount: Surface Mount; Case/Package: 0603; Number of Pins: 2; Core Material: Ferrite; Case Code (Metric): 1608; Case Code (Imperial): 0603; Material: Ferrite; Min Operating Temperature: -40°C; Max Operating Temperature: 125°C; Packaging: Tape and Reel; Frequency: 100MHz; Package Quantity: 1; Impedance: 330R; Tolerance: 25%; Max Current Rating: 800mA; Termination: SMD/SMT; Test Frequency: 100MHz; Composition: Ferrite Bead; Length: 1.6mm; Height: 0.8mm; Width: 0.031inch; Depth: 0.95mm; Lead Free: Lead Free; Halogen Free: Halogen Free; ComponentLink1URL: https://datasheet.ciiva.com/1012/fbmh1608hl331-t-ss-1012496.pdf?src-supplier=Digi-Key; ComponentLink1Description: https://datasheet.ciiva.com/1012/fbmh1608hl331-t-ss-1012496.pdf?src-supplier=Digi-Key; ComponentLink2URL: https://datasheet.ciiva.com/25614/0900766b810b37be-25614404.pdf?src-supplier=RSComponents; ComponentLink2Description: https://datasheet.ciiva.com/25614/0900766b810b37be-25614404.pdf?src-supplier=RSComponents; ComponentLink3URL: https://datasheet.ciiva.com/1012/chipbeads01-e-1012495.pdf?src-supplier=Digi-Key; ComponentLink3Description: https://datasheet.ciiva.com/1012/chipbeads01-e-1012495.pdf?src-supplier=Digi-Key; ComponentLink4URL: https://datasheet.ciiva.com/1012/chipbeads01-e-1012494.pdf?src-supplier=Digi-Key; ComponentLink4Description: https://datasheet.ciiva.com/1012/chipbeads01-e-1012494.pdf?src-supplier=Digi-Key
R442 = Resistor: as R431 on sheet 5V_to_3V3; Supplier 1: Digi-Key; Supplier Part Number 1: P100KDECT-ND; Stock 1: 54338; Pricing 1: 1=0.22000, 10=0.18800, 100=0.07350, 1000=0.03077, 2500=0.02820, 5000=0.02564 (USD); RoHS: Yes; Mount: Surface Mount; Case Code (Imperial): 0402; Case Code (Metric): 1005; Contact Plating: Tin; Min Operating Temperature: -55°C; Max Operating Temperature: 155°C; Resistance: 100kR; Packaging: Tape and Reel; Package Quantity: 10000; Composition: Metal Film,Thin Film; Number of Terminations: 2; Military Standard: Not; Termination: SMD/SMT; Max Power Dissipation: 63mW; Voltage Rating (DC): 25V; Length: 1mm; Height: 0.016inch; Width: 0.5mm; Depth: 0.5mm; Radiation Hardening: No; REACH SVHC: No SVHC; Lead Free: Lead Free; ComponentLink1URL: https://datasheet.ciiva.com/24028/aoa0000ce26-197354-24028150.pdf?src-supplier=Mouser; ComponentLink1Description: https://datasheet.ciiva.com/24028/aoa0000ce26-197354-24028150.pdf?src-supplier=Mouser; ComponentLink2URL: https://datasheet.ciiva.com/43470/1776116-43470438.pdf?src-supplier=Farnell; ComponentLink2Description: https://datasheet.ciiva.com/43470/1776116-43470438.pdf?src-supplier=Farnell; ComponentLink3URL: https://datasheet.ciiva.com/7830/1776116-7830920.pdf?src-supplier=Element14; ComponentLink3Description: https://datasheet.ciiva.com/7830/1776116-7830920.pdf?src-supplier=Element14; ComponentLink4URL: https://datasheet.ciiva.com/46378/1776116-46378234.pdf?src-supplier=Element14; ComponentLink4Description: https://datasheet.ciiva.com/46378/1776116-46378234.pdf?src-supplier=Element14; ComponentLink5URL: https://datasheet.ciiva.com/16780/70068849-16780139.pdf?src-supplier=Allied+Electronics; ComponentLink5Description: https://datasheet.ciiva.com/16780/70068849-16780139.pdf?src-supplier=Allied+Electronics; ComponentLink6URL: https://datasheet.ciiva.com/9117/aoa0000ce26-9117229.pdf?src-supplier=Avnet; ComponentLink6Description: https://datasheet.ciiva.com/9117/aoa0000ce26-9117229.pdf?src-supplier=Avnet; ComponentLink7URL: https://datasheet.ciiva.com/16511/aoa0000ce26-16511566.pdf?src-supplier=Avnet+Asia; ComponentLink7Description: https://datasheet.ciiva.com/16511/aoa0000ce26-16511566.pdf?src-supplier=Avnet+Asia; ComponentLink8URL: https://datasheet.ciiva.com/30225/54aoa0000ce26-30225311.pdf?src-supplier=Onlinecomponents.com; ComponentLink8Description: https://datasheet.ciiva.com/30225/54aoa0000ce26-30225311.pdf?src-supplier=Onlinecomponents.com
R443 = Resistor: Panasonic ERA Series Thin Film Surface Mount Fixed Resistor 0805 Case 698k 0.1% 0.125W 25ppm/C; Manufacturer Part Number: ERA-6AEB6983V; Power Rating: 125mW; Voltage Rating: 100V; Temperature Coefficient: 25ppm/°C; Supplier 1: Digi-Key; Supplier Part Number 1: P698KDACT-ND; Manufacturer: Panasonic; RoHS: Yes; Category: Chip SMD Resistors; Stock 1: 9459; Pricing 1: 1=0,36000, 10=0,30200, 100=0,11820, 1000=0,04948, 2500=0,04536 (USD); Mount: Surface Mount; Number of Pins: 2; Weight: 0.000194oz; Case Code (Metric): 2012; Case Code (Imperial): 0805; Contact Plating: Tin; Min Operating Temperature: -55°C; Max Operating Temperature: 155°C; Tolerance: 0.1%; Resistance: 698kR; Packaging: Tape and Reel; Package Quantity: 5000; Composition: Thin Film,Metal Film; Number of Terminations: 2; Termination: SMD/SMT; Max Power Dissipation: 125mW; Voltage Rating (DC): 100V; Features: Automotive AEC-Q200; Length: 2mm; Height: 0.5mm; Width: 1.25mm; Depth: 1.25mm; Radiation Hardening: No; REACH SVHC: No SVHC; Lead Free: Lead Free; ComponentLink1URL: https://datasheet.ciiva.com/11810/0900766b80eb1d8c-11810720.pdf?src-supplier=RSComponents; ComponentLink1Description: https://datasheet.ciiva.com/11810/0900766b80eb1d8c-11810720.pdf?src-supplier=RSComponents; ComponentLink2URL: https://datasheet.ciiva.com/41450/001181413-da-01-en-widerstand-era-0805-698k-0-1-5000st-41450573.pdf?src-supplier=Conrad; ComponentLink2Description: https://datasheet.ciiva.com/41450/001181413-da-01-en-widerstand-era-0805-698k-0-1-5000st-41450573.pdf?src-supplier=Conrad; ComponentLink3URL: https://datasheet.ciiva.com/6138/485442-6138277.pdf?src-supplier=Farnell; ComponentLink3Description: https://datasheet.ciiva.com/6138/485442-6138277.pdf?src-supplier=Farnell; ComponentLink4URL: https://datasheet.ciiva.com/9180/aoa0000ce26-9180341.pdf?src-supplier=Avnet; ComponentLink4Description: https://datasheet.ciiva.com/9180/aoa0000ce26-9180341.pdf?src-supplier=Avnet; ComponentLink5URL: https://datasheet.ciiva.com/17205/aoa0000ce26-17205334.pdf?src-supplier=Avnet+Europe; ComponentLink5Description: https://datasheet.ciiva.com/17205/aoa0000ce26-17205334.pdf?src-supplier=Avnet+Europe; ComponentLink6URL: https://datasheet.ciiva.com/6138/485442-6138279.pdf?src-supplier=Farnell; ComponentLink6Description: https://datasheet.ciiva.com/6138/485442-6138279.pdf?src-supplier=Farnell; ComponentLink7URL: https://datasheet.ciiva.com/7753/485442-7753914.pdf?src-supplier=Element14; ComponentLink7Description: https://datasheet.ciiva.com/7753/485442-7753914.pdf?src-supplier=Element14; ComponentLink8URL: https://datasheet.ciiva.com/7753/485442-7753915.pdf?src-supplier=Element14; ComponentLink8Description: https://datasheet.ciiva.com/7753/485442-7753915.pdf?src-supplier=Element14
R444 R445 = Resistor: Res Thin Film 0402 49.9K Ohm 0.1% 1/16W 25ppm/C Molded SMD SMD Punched Carrier T/R; Manufacturer: Panasonic; Manufacturer Part Number: ERA-2AEB4992X; Power Rating: 62.5mW; Temperature Coefficient: 25ppm/°C; Voltage Rating: 50V; Max Power Dissipation: 63mW; Supplier 1: Digi-Key; Supplier Part Number 1: P49.9KDCCT-ND; RoHS: Yes; Category: Chip SMD Resistors; Stock 1: 70823; Pricing 1: 1=0,43000, 10=0,30500, 100=0,12220, 1000=0,06021, 2500=0,05579, 5000=0,05047 (USD); Mount: Surface Mount; Case Code (Metric): 1005; Case Code (Imperial): 0402; Contact Plating: Tin; Min Operating Temperature: -55°C; Max Operating Temperature: 155°C; Resistance: 49.9kR; Packaging: Tape and Reel; Tolerance: 0.1%; Package Quantity: 1; Composition: Thin Film; Number of Terminations: 2; Voltage Rating (DC): 50V; Features: Automotive AEC-Q200; Military Standard: Not; Length: 1mm; Height: 0.016inch; Width: 0.02inch; Depth: 0.5mm; REACH SVHC: Unknown; Lead Free: Lead Free; ComponentLink1URL: https://datasheet.ciiva.com/9189/aoa0000ce26-9189149.pdf?src-supplier=Avnet; ComponentLink1Description: https://datasheet.ciiva.com/9189/aoa0000ce26-9189149.pdf?src-supplier=Avnet
U62 = LT3042EDD#PBF: LINEAR TECHNOLOGY         LT3042EDD#PBF             LDO Voltage Regulator, Adjustable, 1.8V to 20V in, 350mV drop, 0V to 15V/0.2A out, DFN-10; Manufacturer: Analog Devices / Linear Technology; Output Voltage: 15V; Output Current: 200mA; Number of Regulators: 1; Min Current Limit: 220mA; Min Output Voltage: 0uV; Supplier 1: Digi-Key; Manufacturer Part Number: LT3042EDD#PBF; RoHS: Yes; Category: Voltage Regulators - Linear; Stock 1: 15977; Pricing 1: 1=5,46000, 25=3,62360, 100=2,99600 (USD); Mount: Surface Mount; Case/Package: DFN; Number of Pins: 10; Min Operating Temperature: -40°C; Max Operating Temperature: 125°C; Packaging: Rail/Tube; Dropout Voltage: 350mV; Min Input Voltage: 1.8V; Max Input Voltage: 20V; Max Output Voltage: 15V; Output Type: Adjustable; REACH SVHC: No SVHC; ComponentLink1URL: http://www.farnell.com/datasheets/1941078.pdf?src-supplier=Farnell; ComponentLink1Description: http://www.farnell.com/datasheets/1941078.pdf?src-supplier=Farnell; ComponentLink2URL: http://www.linear.com/docs/55649?src-supplier=Digi-Key; ComponentLink2Description: http://www.linear.com/docs/55649?src-supplier=Digi-Key; ComponentLink3URL: http://www.farnell.com/datasheets/1941078.pdf?src-supplier=Element14; ComponentLink3Description: http://www.farnell.com/datasheets/1941078.pdf?src-supplier=Element14